# Altium schematic sheet nrf8720dn.SchDoc
size A3; SheetNumber: 2; SheetTotal: 2
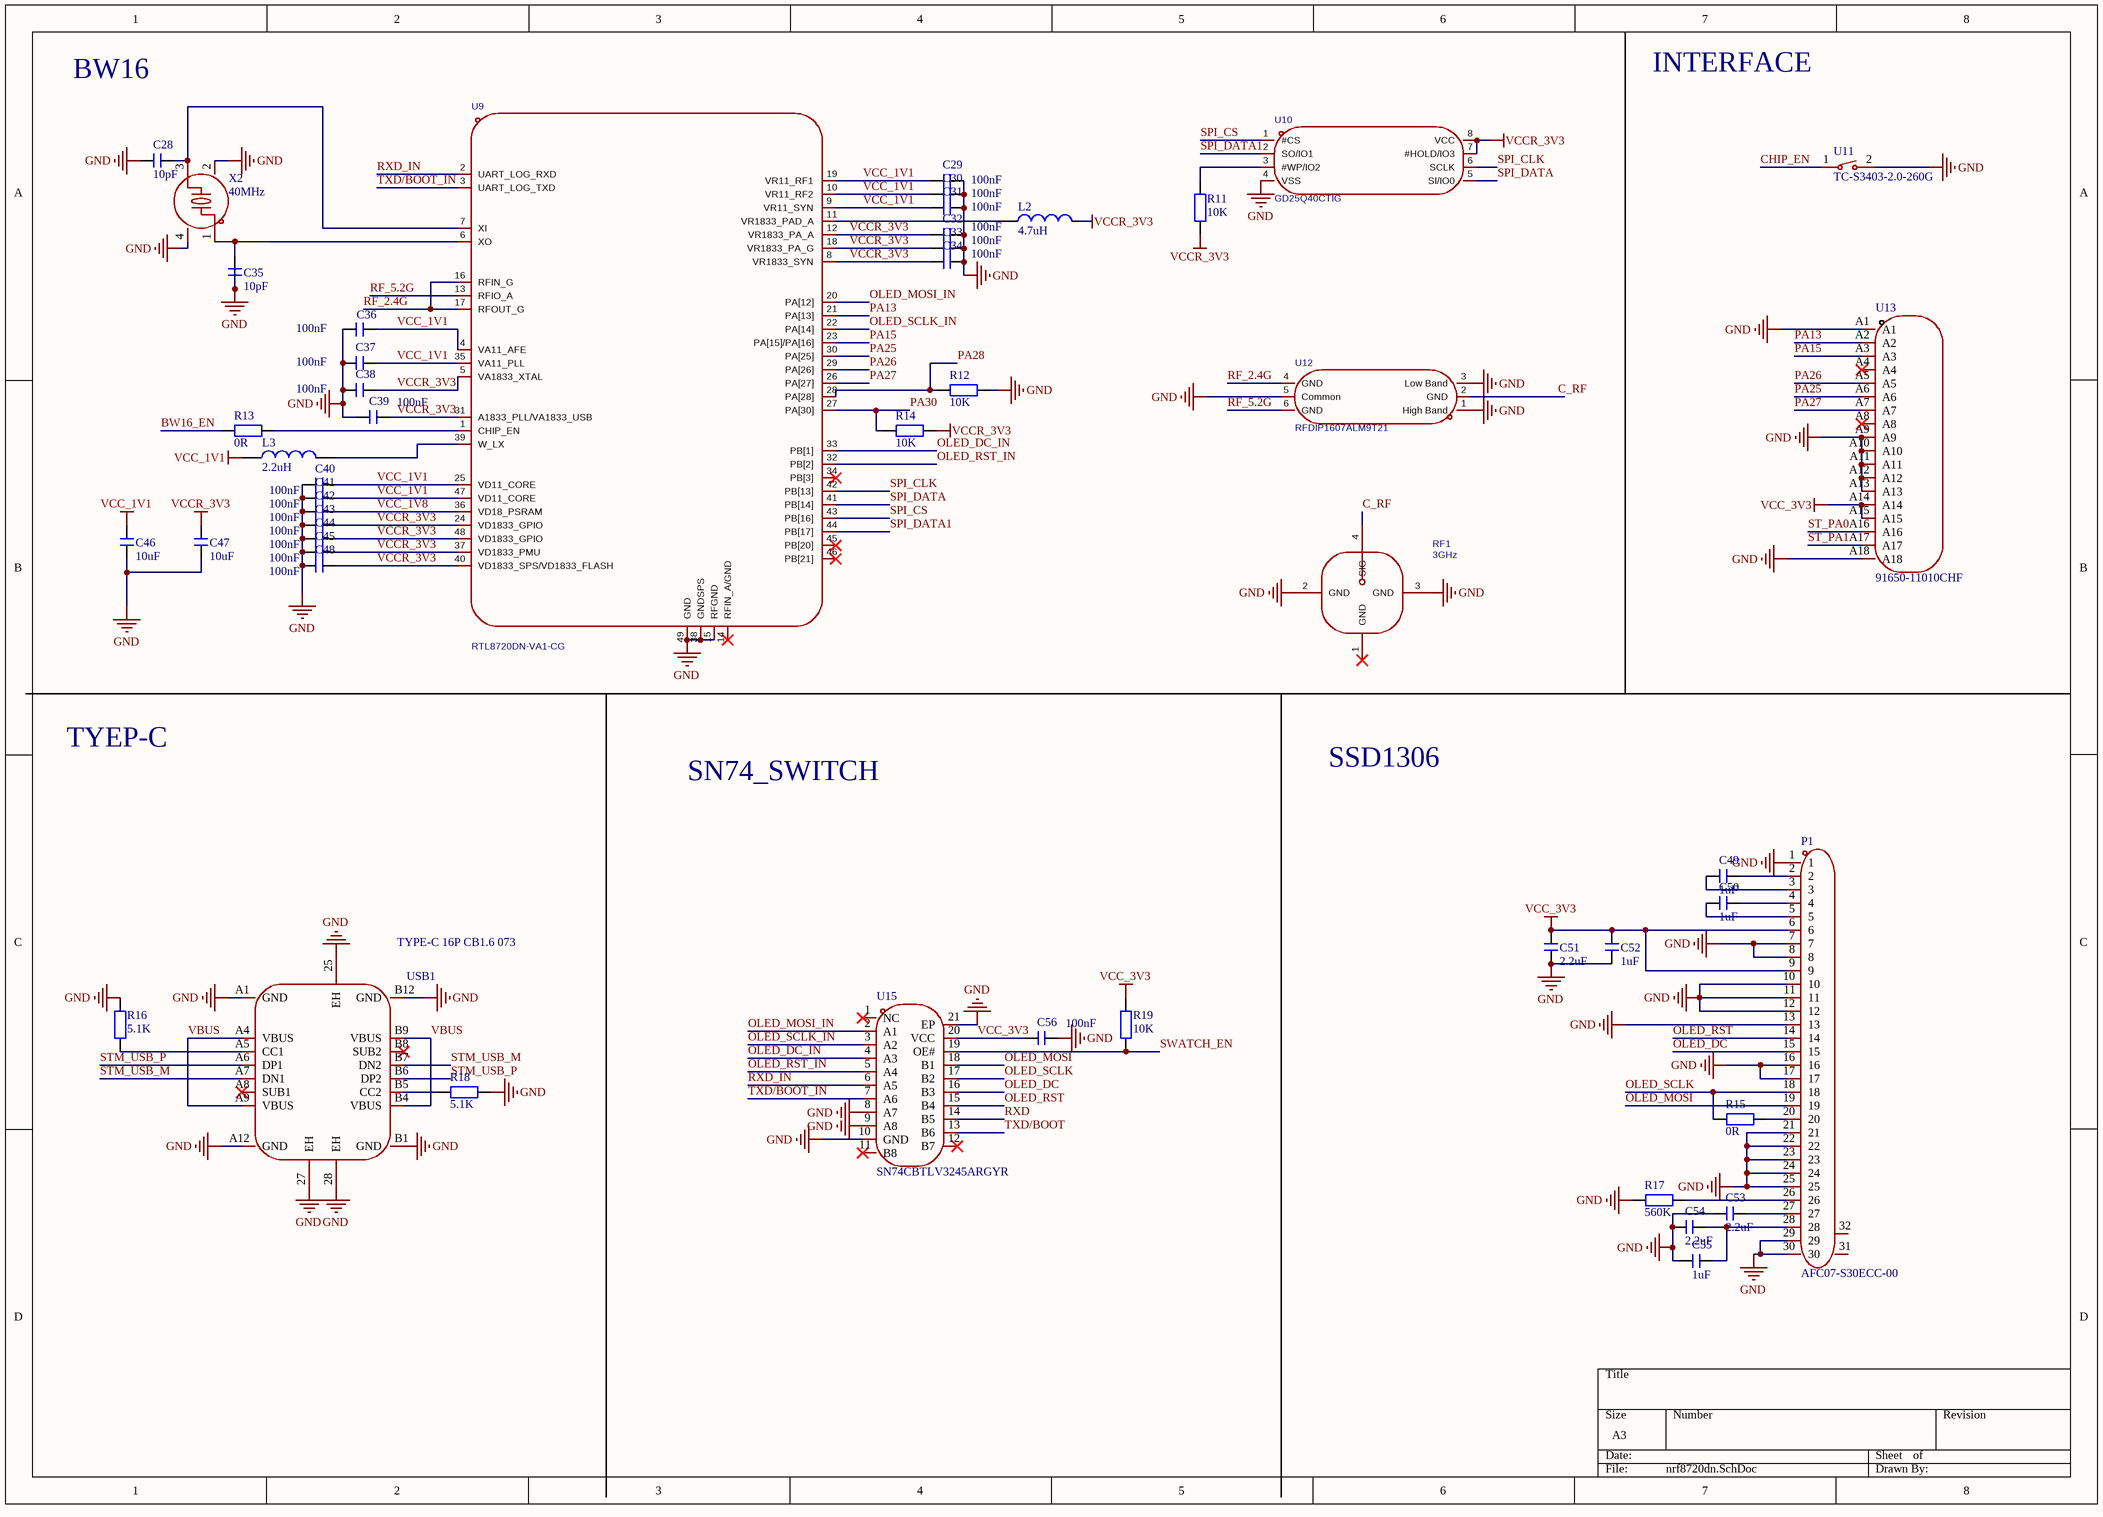
[diagram p0: nrf8720dn.SchDoc]

## Parts
C28  10pF  [C 0402_L]
C29  100nF  [C 0402_L]
C30  100nF  [C 0402_L]
C31  100nF  [C 0402_L]
C32  100nF  [C 0402_L]
C33  100nF  [C 0402_L]
C34  100nF  [C 0402_L]
C35  10pF  [C 0402_L]
C36  100nF  [C 0402_L]
C37  100nF  [C 0402_L]
C38  100nF  [C 0402_L]
C39  100nF  [C 0402_L]
C40  100nF  [C 0402_L]
C41  100nF  [C 0402_L]
C42  100nF  [C 0402_L]
C43  100nF  [C 0402_L]
C44  100nF  [C 0402_L]
C45  100nF  [C 0402_L]
C46  10uF  [C 0402_L]
C47  10uF  [C 0402_L]
C48  100nF  [C 0402_L]
C49  1uF  [C 0402_L]
C50  1uF  [C 0402_L]
C51  2.2uF  [C 0402_L]
C52  1uF  [C 0402_L]
C53  2.2uF  [C 0402_L]
C54  2.2uF  [C 0402_L]
C55  1uF  [C 0402_L]
C56  100nF  [C 0402_L]
L2  4.7uH  [L 0603]
L3  2.2uH  [L 0805]
P1  AFC07-S30ECC-00  [FPC-SMD_AFC07-S30ECC-00]
R11  10K  [R 0402_L]
R12  10K  [R 0402_L]
R13  0R  [R 0402_L]
R14  10K  [R 0402_L]
R15  0R  [R 0402_L]
R16  5.1K  [R 0402_L]
R17  560K  [R 0402_L]
R18  5.1K  [R 0402_L]
R19  10K  [R 0402_L]
RF1  3GHz  [ANT-SMD_KH-IPEX-K501-29]
U9  RTL8720DN-VA1-CG  [VQFN-48_L6.0-W6.0-P0.40-TL-EP4.7]
U10  GD25Q40CTIG  [SOP-8_L4.9-W3.9-P1.27-LS6.0-BL]
U11  TC-S3403-2.0-260G  [SW-SMD_L3.0-W2.0-LS3.5]
U12  RFDIP1607ALM9T21  [XFMR-SMD_6P-L1.6-W0.8-P0.55-BL]
U13  91650-11010CHF  [PCIE 1X - single c]
U15  SN74CBTLV3245ARGYR  [VQFN-20_L4.5-W3.5-P0.50-BL-EP-1]
USB1  TYPE-C 16P CB1.6 073  [USB-C-SMD_SHOU_TYPE-C-16P-CB1.6 -Crabit]
X2  40MHz  [CRYSTAL-SMD_4P-L2.0-W1.6-BL]

## Nets
GND: C28.2 C29.1 C30.1 C31.1 C32.1 C33.1 C34.1 C35.1 C36.2 C37.2 C38.2 C39.2 C40.2 C41.2 C42.2 C43.2 C44.2 C45.2 C46.2 C47.2 C48.2 C51.2 C52.1 C53.1 C54.1 C55.1 C56.1 P1.1 P1.7 P1.8 P1.10 P1.11 P1.12 P1.13 P1.16 P1.17 P1.21 P1.22 P1.23 P1.24 P1.25 P1.29 P1.30 R12.1 R16.2 R17.1 R18.1 RF1.2(GND) RF1.3(GND) U9.15(RFGND) U9.38(GNDSPS) U9.49(GND) U10.4(VSS) U11.2 U12.1(High_Band) U12.3(Low_Band) U12.5(Common) U13.A1 U13.A9 U13.A10 U13.A11 U13.A12 U13.A13 U13.A18 U15.8(A7) U15.9(A8) U15.10(GND) U15.21(EP) USB1.25(EH) USB1.27(EH) USB1.28(EH) USB1.A1(GND) USB1.A12(GND) USB1.B1(GND) USB1.B12(GND) X2.2(GND) X2.4(GND)
VCC_1V1: C29.2 C30.2 C31.2 C36.1 C37.1 C40.1 C41.1 C46.1 L3.1 U9.4(VA11_AFE) U9.9(VR11_SYN) U9.10(VR11_RF2) U9.19(VR11_RF1) U9.25(VD11_CORE) U9.35(VA11_PLL) U9.47(VD11_CORE)
VCC_3V3: C51.1 C52.2 C56.2 P1.6 P1.9 R19.1 U13.A14 U13.A15 U15.20(VCC)
VCCR_3V3: C32.2 C33.2 C34.2 C38.1 C39.1 C43.1 C44.1 C45.1 C47.1 C48.1 L2.2 R11.1 R14.1 U9.5(VA1833_XTAL) U9.8(VR1833_SYN) U9.12(VR1833_PA_A) U9.18(VR1833_PA_G) U9.24(VD1833_GPIO) U9.31(A1833_PLL/VA1833_USB) U9.37(VD1833_PMU) U9.40(VD1833_SPS/VD1833_FLASH) U9.48(VD1833_GPIO) U10.7(#HOLD/IO3) U10.8(VCC)
BW16_EN: R13.2
C_RF: RF1.4(SIG) U12.2(GND)
CHIP_EN: U11.1
OLED_DC: P1.15 U15.16(B3)
OLED_DC_IN: U9.33(PB[1]) U15.4(A3)
OLED_MOSI: P1.19 U15.18(B1)
OLED_MOSI_IN: U9.20(PA[12]) U15.2(A1)
OLED_RST: P1.14 U15.15(B4)
OLED_RST_IN: U9.32(PB[2]) U15.5(A4)
OLED_SCLK: P1.18 R15.1 U15.17(B2)
OLED_SCLK_IN: U9.22(PA[14]) U15.3(A2)
PA13: U9.21(PA[13]) U13.A2
PA15: U9.23(PA[15]/PA[16]) U13.A3
PA25: U9.30(PA[25]) U13.A6
PA26: U9.29(PA[26]) U13.A5
PA27: U9.26(PA[27]) U13.A7
PA28: R12.2 U9.28(PA[28])
PA30: R14.2 U9.27(PA[30])
RF_2.4G: U9.16(RFIN_G) U9.17(RFOUT_G) U12.4(GND)
RF_5.2G: U9.13(RFIO_A) U12.6(GND)
RXD: U15.14(B5)
RXD_IN: U9.2(UART_LOG_RXD) U15.6(A5)
SPI_CLK: U9.42(PB[13]) U10.6(SCLK)
SPI_CS: U9.43(PB[16]) U10.1(#CS)
SPI_DATA: U9.41(PB[14]) U10.5(SI/IO0)
SPI_DATA1: U9.44(PB[17]) U10.2(SO/IO1)
ST_PA0: U13.A16
ST_PA1: U13.A17
STM_USB_M: USB1.A7(DN1) USB1.B7(DN2)
STM_USB_P: USB1.A6(DP1) USB1.B6(DP2)
SWATCH_EN: R19.2 U15.19(OE#)
TXD/BOOT: U15.13(B6)
TXD/BOOT_IN: U9.3(UART_LOG_TXD) U15.7(A6)
VBUS: USB1.A4(VBUS) USB1.A9(VBUS) USB1.B4(VBUS) USB1.B9(VBUS)
VCC_1V8: C42.1 U9.36(VD18_PSRAM)
NetC28_1: C28.1 U9.7(XI) X2.3
NetC35_2: C35.2 U9.6(XO) X2.1
NetC49_1: C49.1 P1.2
NetC49_2: C49.2 P1.3
NetC50_1: C50.1 P1.4
NetC50_2: C50.2 P1.5
NetC53_2: C53.2 P1.27
NetC54_2: C54.2 C55.2 P1.28
NetL2_1: L2.1 U9.11(VR1833_PAD_A)
NetL3_2: L3.2 U9.39(W_LX)
NetP1_20: P1.20 R15.2
NetP1_26: P1.26 R17.2
NetR11_2: R11.2 U10.3(#WP/IO2)
NetR13_1: R13.1 U9.1(CHIP_EN)
NetR16_1: R16.1 USB1.A5(CC1)
NetR18_2: R18.2 USB1.B5(CC2)

Not connected (* = marked no-connect by the designer): P1 31 32; RF1 1(GND)*; U9 14(RFIN_A/GND)* 34(PB[3])* 45(PB[20])* 46(PB[21])*; U13 A4* A8*; U15 1(NC)* 11(B8)* 12(B7)*; USB1 A8(SUB1)* B8(SUB2)*

## Notes on the sheet
- BW16
- INTERFACE
- TYEP-C
- SN74_SWITCH
- SSD1306

## Library data of the parts
C28-C56 = C: 贴片电容; BOM名称: 无极性贴片电容; 淘宝ID: 封装库来自淘宝 ID：黄晶宝石; 联系售后，技术支持: https://shop463601444.taobao.com; 唯一出售店铺网址: https://shop463601444.taobao.com
L2 L3 = L: 小功率贴片电感; 淘宝ID: 封装库来自淘宝 ID：黄晶宝石; 封装库来自淘宝卖家 ID：黄晶宝石: 其他店铺购入均为盗版，不享受售后技术支持服务，请立即申请退款; BOM名称: 小功率贴片电感; 联系售后: https://shop463601444.taobao.com
P1 = AFC07-S30ECC-00: Manufacturer: JS(钜硕电子); Symbol: FPC 0.5MM 30P Pull type H2.0mm Pick up; Add into BOM: yes; Locking Feature: 抽屉式; Number of Contacts: 30P; Pitch: 0.5mm; FFC, FCB Thickness: 0.3mm; Rated Voltage (Max): 50V; Current Rating (Max): 400mA; Device: AFC07-S30ECC-00; LCSC Part Name: 抽屉式 上接 P数:30P 间距:0.5mm; Supplier Part: C11095; Manufacturer Part: AFC07-S30ECC-00; Supplier Footprint: SMD,P=0.5mm,卧贴; JLCPCB Part Class: 扩展库; Datasheet: https://item.szlcsc.com/datasheet/AFC07-S30ECC-00/11642.html; Supplier: LCSC; Convert to PCB: yes; Contact Type: 上接; Mounting Type: 卧贴; Height Above Board: 2mm; Contact Material: 磷青铜; Contact Plating: 锡; Operating Temperature: -25℃~+85℃
R11-R19 = R: 贴片电阻; 版权归属: 来自淘宝 ID：黄晶宝石; 封装库来自淘宝卖家 ID：黄晶宝石: 其他店铺购入均为盗版，不享受售后技术支持服务，请立即申请退款; BOM名称: 贴片电阻; 联系售后: https://shop463601444.taobao.com
RF1 = KH-IPEX-K501-29: 连接器类型:板端;接口类型:内针;端口数量:1;接口直径:2mm;接口长度/高度:1.25mm;频率:3GHz;射频系列:IPEX;阻抗:50Ω;样式:-;工作温度:-40℃~+90℃;; Manufacturer: kinghelm(金航标); AddInBom: yes; ModelId: 1390225c983f4fdcaa73eb43ca25e5d4聨0819f05c4eef4c71ace90d822a990e87; ModelTransform: 118.11,122.8344,0,0,0,0,0,0,0; Connector Type: 板端; Interface: 内针; Number of Ports: 1; Interface Diameter: 2mm; Interface Length/Height: 1.25mm; RF Series: IPEX; Impedance: 50Ω; Symbol: KH-IPEX-K501-29; Device: KH-IPEX-K501-29; LCSC Part Name: IPEX 内针; SupplierPart: C411563; ManufacturerPart: KH-IPEX-K501-29; Supplier Footprint: SMD; JLCPCB Part Class: Extended Part; Datasheet: https://item.szlcsc.com/datasheet/KH-IPEX-K501-29/402820.html; Supplier: LCSC; ConvertToPcb: yes; FootprintName: ANT-SMD_KH-IPEX-K501-29; ModelName: ANT-SMD_KH-IPEX-K501-29; Value: 3GHz; Style: -; Operating Temperature Range: -40℃~+90℃
U9 = RTL8720DN-VA1-CG: AddInBom: yes; ModelId: 75d8b471759e4c1a921823be2700eba1聨0819f05c4eef4c71ace90d822a990e87; ModelTransform: 237.007,237.007,0,0,0,0,0,0,0; Symbol: RTL8720DN-VA1-CG; Device: RTL8720DN-VA1-CG; LCSC Part Name: RTL8720DN-VA1-CG; SupplierPart: C9900165242; ManufacturerPart: RTL8720DN-VA1-CG; Supplier Footprint: QFN-48; Supplier: LCSC; ConvertToPcb: yes; FootprintName: VQFN-48_L6.0-W6.0-P0.40-TL-EP4.7; ModelName: VQFN-48_L6.0-W6.0-P0.40-TL-EP4.7
U10 = GD25Q40CTIG: 接口类型:SPI;存储容量:4Mbit;时钟频率(fc):120MHz;; Manufacturer: GigaDevice(兆易创新); AddInBom: yes; ModelId: 75c24a7891ee4dd6bdac16a7163ff87e聨0819f05c4eef4c71ace90d822a990e87; ModelName: SOP-8_L4.9-W3.9-P1.27-LS6.0-BL-1; ModelTransform: 192.913,236.22,0,0,0,0,0,0,0; Interface: SPI; Memory Size: 4Mbit; Clock Frequency: 120MHz; Voltage - Supply: 2.7V~3.6V; Standby Supply Current: 5uA; Program / Erase Cycles: 100000次; Page Programming Time (Tpp): 600us; Block Erase Time(tBE): 150ms@(32KB); Data Retention - TDR (Year): 20年; Symbol: GD25Q40CTIG; Device: GD25Q40CTIG; LCSC Part Name: 3.3V统一扇区双路和四路串行闪存; SupplierPart: C79077; ManufacturerPart: GD25Q40CTIG; Supplier Footprint: SOP-8; JLCPCB Part Class: Extended Part; Datasheet: https://item.szlcsc.com/datasheet/GD25Q40CTIG/80214.html; Supplier: LCSC; ConvertToPcb: yes; FootprintName: SOP-8_L4.9-W3.9-P1.27-LS6.0-BL; Operating Temperature: -
U11 = TC-S3403-2.0-260G: 微动开关; Manufacturer: HCTL(华灿天禄); Add into BOM: yes; Circuit: 单刀单掷; Actuator Style: 圆形按钮; Operating Force: 2.6N; Switch Length: 3.95mm; Switch Width: 3mm; Switch Height: 2mm; Strike Gundam: 不带; Contact Current: 50mA; Voltage Rating (DC): 12V; Insulation Resistance: 100MΩ; Actuator/Cap Color: 黑色; With Lamp: 无; Mechanical Life: 5万次; Symbol: TC-S3403-2.0-260G; Device: TC-S3403-2.0-260G; LCSC Part Name: TC-S3403-2.0-260G; Supplier Part: C5372844; Manufacturer Part: TC-S3403-2.0-260G; Supplier Footprint: SMD; Datasheet: https://atta.szlcsc.com/upload/public/pdf/source/20230320/549E467C3F97F31F1E4EF0A0B79060CE.pdf; Supplier: LCSC; Convert to PCB: yes; Mounting Style: 立贴; Voltage Rating (AC): -; Operating Temperature: -25℃~+70℃
U12 = RFDIP1607ALM9T21: 工作电压:-;元件数:-;触发沿:-;计数速率:-;; Manufacturer: Walsin(华新科); AddInBom: yes; ModelId: dfdfe6a65c7d48819bbe5549325001e2聨0819f05c4eef4c71ace90d822a990e87; ModelName: XFMR-SMD_6P-L1.6-W0.8-H0.6-P0.55-BL; ModelTransform: 62.992,31.496,0,0,0,0,0,0.005,0; Symbol: RFDIP1607ALM9T21; Device: RFDIP1607ALM9T21; LCSC Part Name: 分频器 FDD; SupplierPart: C2992319; ManufacturerPart: RFDIP1607ALM9T21; Supplier Footprint: SMD-6P,1.6x0.8mm; JLCPCB Part Class: Extended Part; Datasheet: https://item.szlcsc.com/datasheet/RFDIP1607ALM9T21/3456647.html; Supplier: LCSC; ConvertToPcb: yes; FootprintName: XFMR-SMD_6P-L1.6-W0.8-P0.55-BL; Logic Type: -; Direction: -; Voltage - Supply: -; Number of Elements: -; Trigger Type: -; Reset: -; Timing: -; Count Rate: -; Operating Temperature: -; Number of Bits per Element: -; Propagation Delay: -; Power Dissipation: -; Features: -
U13 = 91650-11010CHF_C: Manufacturer: UMaxconn(友贸); Add into BOM: yes; Number of Data Pins: 142P; Versions: PCI-E 5.0; Supplementary Features: 带柱; Symbol: 91650-11010CHF; Device: 91650-11010CHF; LCSC Part Name: PCIE5.0 PCI-E SMT 立贴 36PIN (X1) 镀金15u 无卤 CAP; Supplier Part: C5210926; Manufacturer Part: 91650-11010CHF; Supplier Footprint: SMD,P=1mm; JLCPCB Part Class: 扩展库; Datasheet: https://item.szlcsc.com/datasheet/91650-11010CHF/5905330.html; Supplier: LCSC; Convert to PCB: yes; Connector Type: -; Number of Pins: 36P; Mounting Type: 立贴; Height Above Board: 11.25mm; Operating Temperature: -40℃~+85℃
U15 = SN74CBTLV3245ARGYR: Manufacturer: TI(德州仪器); Add into BOM: yes; Symbol: SN74CBTLV3245ARGYR; Device: SN74CBTLV3245ARGYR; LCSC Part Name: 低电压八进制FET总线开关，支持部分掉电模式; Supplier Part: C2674597; Manufacturer Part: SN74CBTLV3245ARGYR; Supplier Footprint: VQFN-20-EP(3.5x4.5); JLCPCB Part Class: 扩展库; Datasheet: https://www.ti.com/cn/lit/gpn/sn74cbtlv3245a; Supplier: LCSC; Convert to PCB: yes
USB1 = TYPE-C 16P CB1.6 073_C: Manufacturer: SHOU HAN(首韩); Add into BOM: yes; Protocol Standard: USB 3.1; Gender: 母; Number of Ports: 1; Current Rating-Power: 3A; Voltage Rating: 5V; Connect-Disconnect Life: 5千次; Detection color: 黑色; Symbol: TYPE-C 16P CB1.6 073; Device: TYPE-C 16P CB1.6 073; LCSC Part Name: 16P卧贴母座; Supplier Part: C2906290; Manufacturer Part: TYPE-C 16P CB1.6 073; Supplier Footprint: SMD; JLCPCB Part Class: 扩展库; Datasheet: https://item.szlcsc.com/datasheet/TYPE-C%252016P%2520CB1.6%2520073/3179000.html; Supplier: LCSC; Convert to PCB: yes; Connector Type: Type-C; Mounting Type: 沉板; Number of Contacts: 16P; Operating Temperature: -25℃~+85℃
X2 = 7D040000I01: 晶振类型: 贴片晶振 / 频率: 40MHz / 常温频差: ±10ppm / 负载电容: 10pF / 类目: 无源晶振 / 编号: C648973; Manufacturer: HD(浩都频率); Add into BOM: yes; Frequency Stability(Full temperature range): ±20ppm; Symbol: 7D040000I01; Device: 7D040000I01; LCSC Part Name: 40MHz ±10ppm 10pF; Supplier Part: C648973; Manufacturer Part: 7D040000I01; Supplier Footprint: SMD2016-4P; JLCPCB Part Class: 扩展库; Datasheet: https://atta.szlcsc.com/upload/public/pdf/source/20220223/118C2648083ADD7FA58C5549E27EC941.pdf; Supplier: LCSC; Convert to PCB: yes; Crystal Type: 贴片晶振; Value: 40MHz; Normal temperature Frequency Tolerance: ±10ppm; External load capacitor: 10pF; Operating Temperature: -